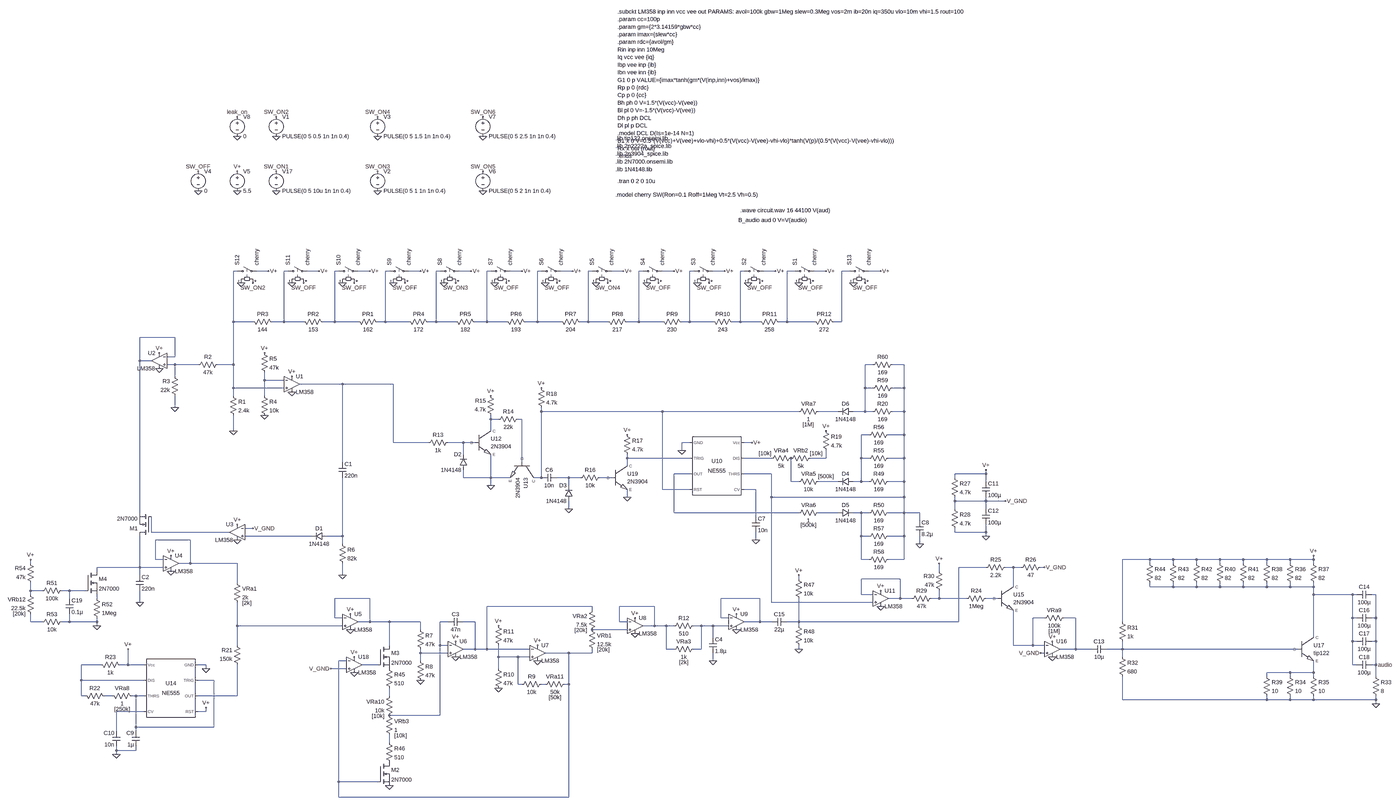
[diagram p0: schematic circuit.asc, whole sheet]
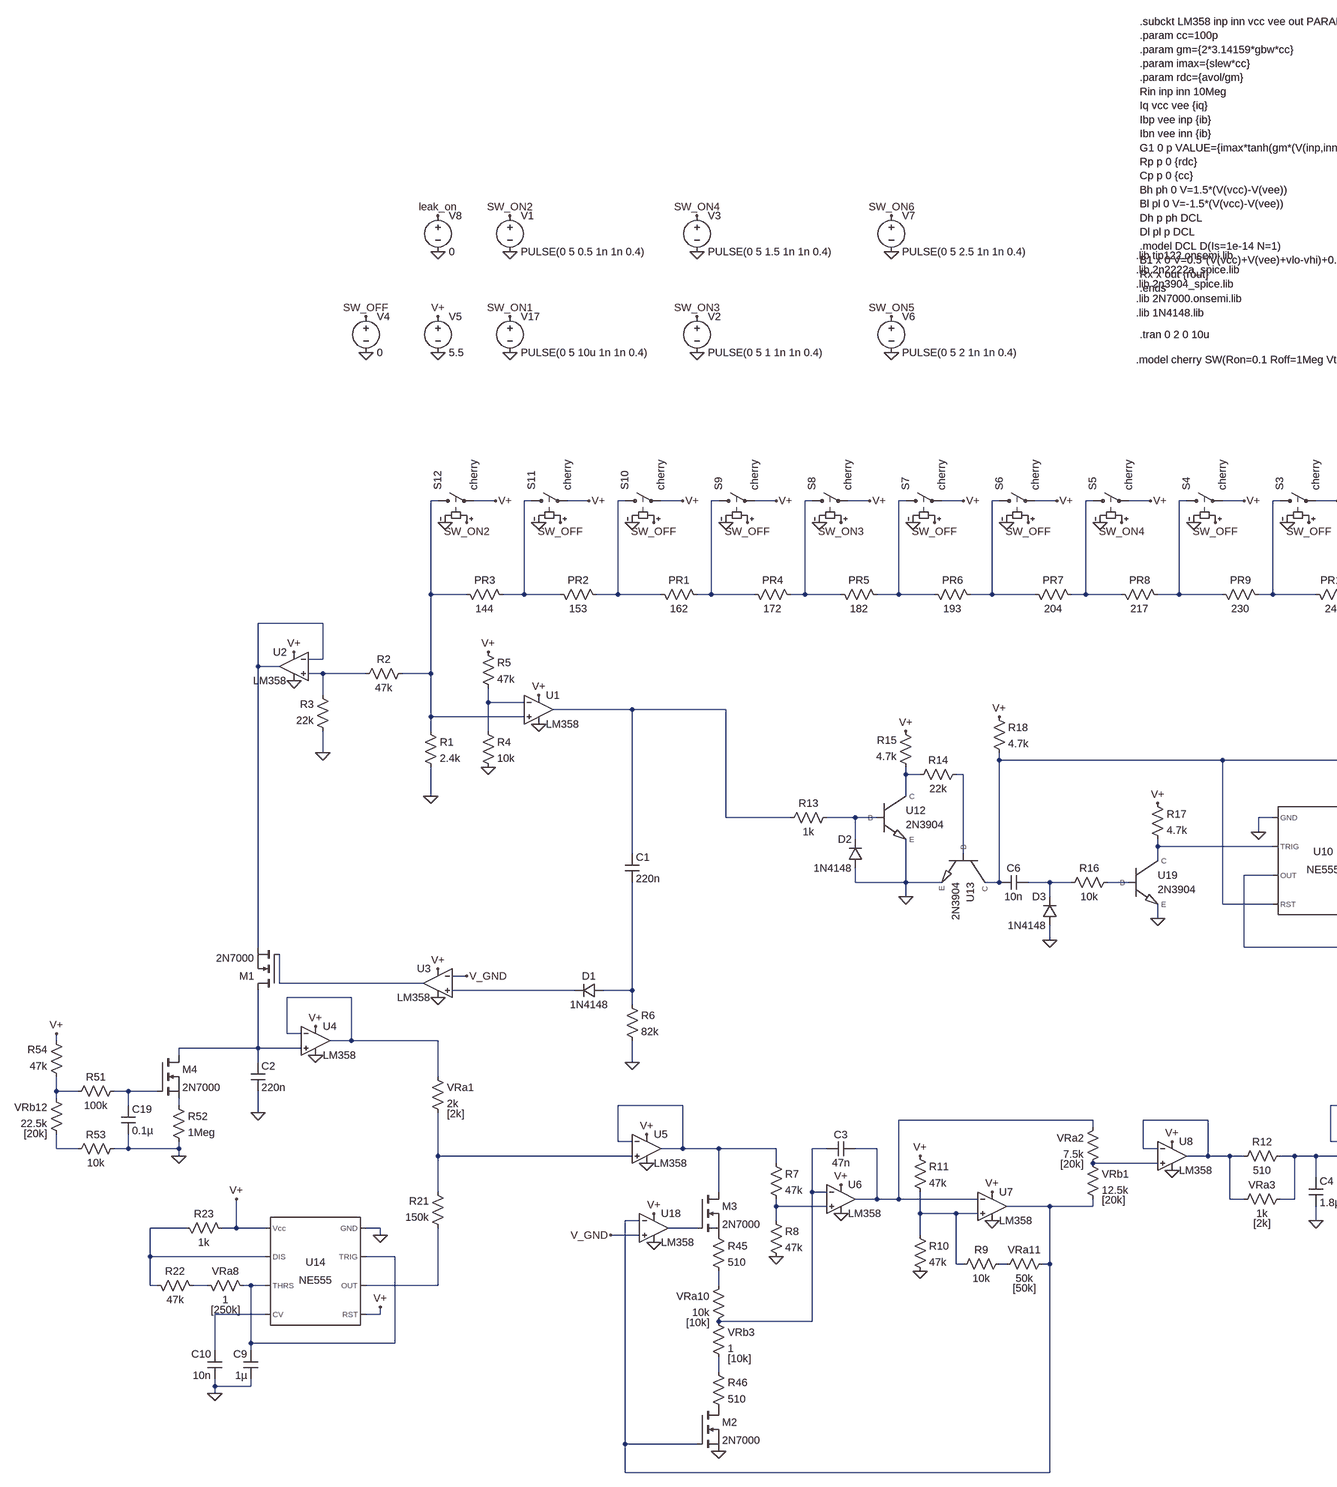
[diagram p1: schematic circuit.asc, part, row 1 of 1, column 1 of 2]
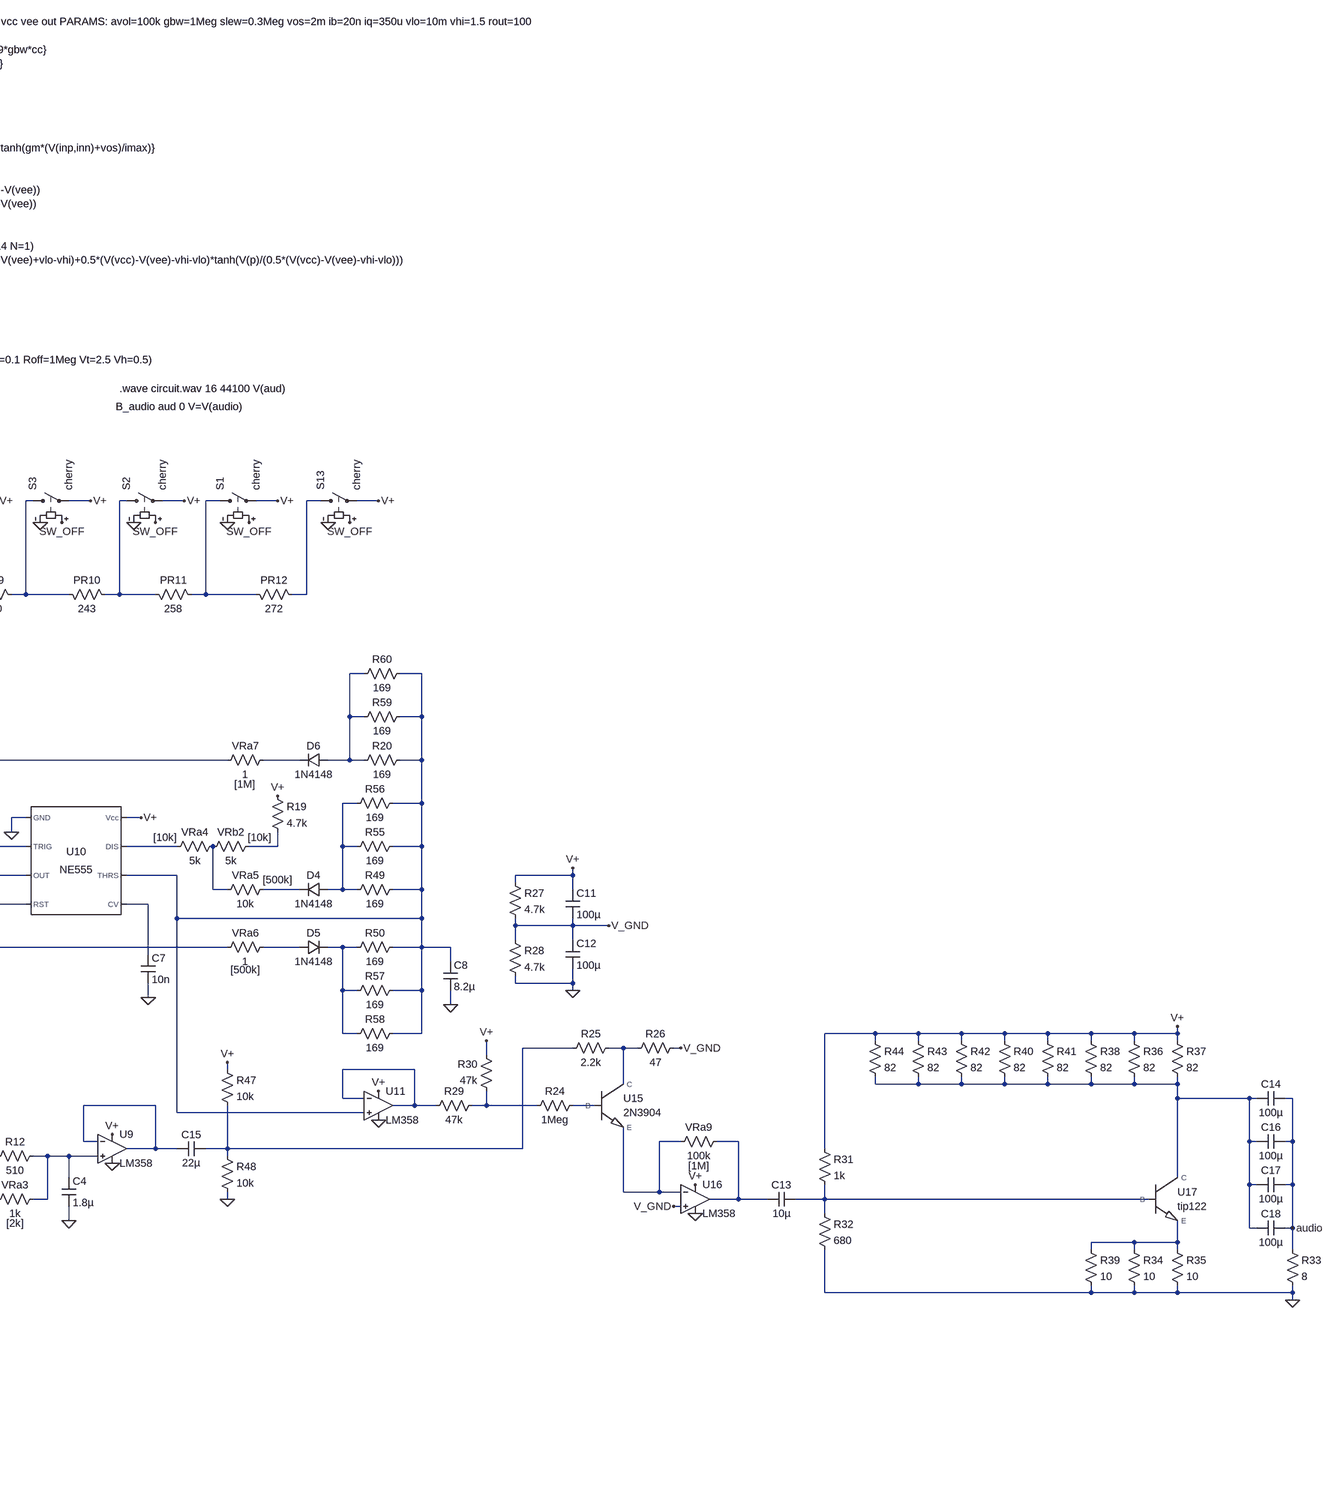
[diagram p2: schematic circuit.asc, part, row 1 of 1, column 2 of 2]
circuit.asc, the LTspice schematic file:
Version 4
SHEET 1 13920 2516
WIRE -1216 -928 -1232 -928
WIRE -1088 -928 -1136 -928
WIRE -1008 -928 -1024 -928
WIRE -880 -928 -928 -928
WIRE -800 -928 -816 -928
WIRE -672 -928 -720 -928
WIRE -592 -928 -608 -928
WIRE -464 -928 -512 -928
WIRE -384 -928 -400 -928
WIRE -256 -928 -304 -928
WIRE -176 -928 -192 -928
WIRE -48 -928 -96 -928
WIRE 32 -928 16 -928
WIRE 160 -928 112 -928
WIRE 240 -928 224 -928
WIRE 368 -928 320 -928
WIRE 448 -928 432 -928
WIRE 576 -928 528 -928
WIRE 656 -928 640 -928
WIRE 784 -928 736 -928
WIRE 864 -928 848 -928
WIRE 992 -928 944 -928
WIRE 1072 -928 1040 -928
WIRE 1200 -928 1152 -928
WIRE 1296 -928 1264 -928
WIRE 1424 -928 1376 -928
WIRE -1232 -720 -1232 -928
WIRE -1152 -720 -1232 -720
WIRE -1024 -720 -1024 -928
WIRE -1024 -720 -1072 -720
WIRE -944 -720 -1024 -720
WIRE -816 -720 -816 -928
WIRE -816 -720 -864 -720
WIRE -720 -720 -816 -720
WIRE -608 -720 -608 -928
WIRE -608 -720 -640 -720
WIRE -512 -720 -608 -720
WIRE -400 -720 -400 -928
WIRE -400 -720 -432 -720
WIRE -320 -720 -400 -720
WIRE -192 -720 -192 -928
WIRE -192 -720 -240 -720
WIRE -112 -720 -192 -720
WIRE 16 -720 16 -928
WIRE 16 -720 -32 -720
WIRE 112 -720 16 -720
WIRE 224 -720 224 -928
WIRE 224 -720 192 -720
WIRE 304 -720 224 -720
WIRE 432 -720 432 -928
WIRE 432 -720 384 -720
WIRE 528 -720 432 -720
WIRE 640 -720 640 -928
WIRE 640 -720 608 -720
WIRE 736 -720 640 -720
WIRE 848 -720 848 -928
WIRE 848 -720 816 -720
WIRE 928 -720 848 -720
WIRE 1040 -720 1040 -928
WIRE 1040 -720 1008 -720
WIRE 1152 -720 1040 -720
WIRE 1264 -720 1264 -928
WIRE 1264 -720 1232 -720
WIRE -1472 -656 -1616 -656
WIRE -1472 -576 -1472 -656
WIRE -1472 -576 -1504 -576
WIRE -1616 -560 -1616 -656
WIRE -1568 -560 -1616 -560
WIRE -1472 -544 -1504 -544
WIRE -1376 -544 -1472 -544
WIRE -1232 -544 -1232 -720
WIRE -1232 -544 -1296 -544
WIRE 1392 -544 1360 -544
WIRE 1520 -544 1472 -544
WIRE -1472 -496 -1472 -544
WIRE -1104 -480 -1104 -512
WIRE -1024 -480 -1104 -480
WIRE -784 -464 -960 -464
WIRE -576 -464 -784 -464
WIRE -1232 -448 -1232 -544
WIRE -1024 -448 -1232 -448
WIRE 1360 -448 1360 -544
WIRE 1392 -448 1360 -448
WIRE 1520 -448 1520 -544
WIRE 1520 -448 1472 -448
WIRE -1232 -416 -1232 -448
WIRE -1104 -416 -1104 -480
WIRE -1472 -368 -1472 -416
WIRE 32 -352 32 -368
WIRE 528 -352 32 -352
WIRE 1088 -352 528 -352
WIRE 1248 -352 1168 -352
WIRE 1360 -352 1360 -448
WIRE 1360 -352 1312 -352
WIRE 1392 -352 1360 -352
WIRE 1520 -352 1520 -448
WIRE 1520 -352 1472 -352
WIRE -176 -320 -176 -336
WIRE -144 -320 -176 -320
WIRE -48 -320 -64 -320
WIRE -1232 -272 -1232 -336
WIRE -176 -272 -176 -320
WIRE 1376 -256 1344 -256
WIRE 1520 -256 1520 -352
WIRE 1520 -256 1456 -256
WIRE -576 -224 -576 -464
WIRE -432 -224 -576 -224
WIRE -288 -224 -352 -224
WIRE -240 -224 -288 -224
WIRE 640 -224 608 -224
WIRE 896 -224 864 -224
WIRE 608 -192 608 -224
WIRE -288 -176 -288 -224
WIRE 384 -160 384 -176
WIRE 640 -160 384 -160
WIRE 976 -160 864 -160
WIRE 1200 -160 1200 -192
WIRE 1200 -160 1136 -160
WIRE 1344 -160 1344 -256
WIRE 1376 -160 1344 -160
WIRE 1520 -160 1520 -256
WIRE 1520 -160 1456 -160
WIRE -784 -144 -784 -464
WIRE -48 -144 -48 -320
WIRE 384 -128 384 -160
WIRE 640 -96 576 -96
WIRE 976 -96 864 -96
WIRE 1856 -96 1856 -112
WIRE 1856 -96 1728 -96
WIRE -288 -80 -288 -112
WIRE -176 -80 -176 -176
WIRE -176 -80 -288 -80
WIRE -96 -80 -176 -80
WIRE 32 -80 32 -352
WIRE 32 -80 0 -80
WIRE 144 -80 96 -80
WIRE 192 -80 144 -80
WIRE 320 -80 272 -80
WIRE 1728 -80 1728 -96
WIRE 1056 -64 1056 -160
WIRE 1088 -64 1056 -64
WIRE 1248 -64 1168 -64
WIRE 1344 -64 1344 -160
WIRE 1344 -64 1312 -64
WIRE 1376 -64 1344 -64
WIRE 1520 -64 1520 -160
WIRE 1520 -64 1456 -64
WIRE 1856 -64 1856 -96
WIRE -176 -48 -176 -80
WIRE 144 -48 144 -80
WIRE 528 -32 528 -352
WIRE 640 -32 528 -32
WIRE 912 -32 864 -32
WIRE 384 0 384 -32
WIRE 976 0 976 -96
WIRE 1520 0 1520 -64
WIRE 1520 0 976 0
WIRE 1728 16 1728 0
WIRE 1856 16 1856 0
WIRE 1856 16 1728 16
WIRE 1936 16 1856 16
WIRE 144 48 144 16
WIRE 1728 48 1728 16
WIRE 1856 48 1856 16
WIRE -1616 64 -1616 -560
WIRE 576 64 576 -96
WIRE 1088 64 576 64
WIRE 1248 64 1168 64
WIRE 1344 64 1312 64
WIRE 1376 64 1344 64
WIRE 1520 64 1520 0
WIRE 1520 64 1456 64
WIRE 1584 64 1520 64
WIRE 912 80 912 -32
WIRE 1584 96 1584 64
WIRE -1152 128 -1184 128
WIRE -1568 144 -1568 80
WIRE -1248 144 -1568 144
WIRE 1728 144 1728 128
WIRE 1856 144 1856 112
WIRE 1856 144 1728 144
WIRE -912 160 -1184 160
WIRE -784 160 -784 -80
WIRE -784 160 -848 160
WIRE 1344 160 1344 64
WIRE 1376 160 1344 160
WIRE 1520 160 1520 64
WIRE 1520 160 1456 160
WIRE 1856 160 1856 144
WIRE -1408 176 -1552 176
WIRE 912 176 912 144
WIRE -784 192 -784 160
WIRE 1584 192 1584 160
WIRE -1552 256 -1552 176
WIRE -1520 256 -1552 256
WIRE 1344 256 1344 160
WIRE 1376 256 1344 256
WIRE 1520 256 1520 160
WIRE 1520 256 1456 256
WIRE 2528 256 2416 256
WIRE 2624 256 2528 256
WIRE 2720 256 2624 256
WIRE 2816 256 2720 256
WIRE 2912 256 2816 256
WIRE 3008 256 2912 256
WIRE 3104 256 3008 256
WIRE 3200 256 3200 240
WIRE 3200 256 3104 256
WIRE -2064 272 -2064 256
WIRE -1408 272 -1408 176
WIRE -1408 272 -1456 272
WIRE -1216 272 -1408 272
WIRE 2528 272 2528 256
WIRE 2624 272 2624 256
WIRE 2720 272 2720 256
WIRE 2816 272 2816 256
WIRE 2912 272 2912 256
WIRE 3008 272 3008 256
WIRE 3104 272 3104 256
WIRE 3200 272 3200 256
WIRE -1616 288 -1616 160
WIRE -1616 288 -1792 288
WIRE -1520 288 -1616 288
WIRE 1856 288 1744 288
WIRE 1968 288 1936 288
WIRE 2000 288 1968 288
WIRE 2096 288 2080 288
WIRE -1792 304 -1792 288
WIRE 1664 304 1664 272
WIRE -1616 320 -1616 288
WIRE -784 320 -784 272
WIRE 1088 336 1088 320
WIRE 1504 336 1344 336
WIRE -1216 352 -1216 272
WIRE 1968 368 1968 288
WIRE 2528 368 2528 352
WIRE 2624 368 2624 352
WIRE 2624 368 2528 368
WIRE 2720 368 2720 352
WIRE 2720 368 2624 368
WIRE 2816 368 2816 352
WIRE 2816 368 2720 368
WIRE 2912 368 2912 352
WIRE 2912 368 2816 368
WIRE 3008 368 3008 352
WIRE 3008 368 2912 368
WIRE 3104 368 3104 352
WIRE 3104 368 3008 368
WIRE 3200 368 3200 352
WIRE 3200 368 3104 368
WIRE -2064 384 -2064 352
WIRE -2016 384 -2064 384
WIRE -1904 384 -1936 384
WIRE -1840 384 -1904 384
WIRE -2064 400 -2064 384
WIRE 1344 400 1344 336
WIRE 1392 400 1344 400
WIRE 3200 400 3200 368
WIRE 3360 400 3200 400
WIRE 3376 400 3360 400
WIRE 3456 400 3440 400
WIRE -1904 416 -1904 384
WIRE -1792 416 -1792 400
WIRE -672 416 -816 416
WIRE 928 416 768 416
WIRE 1504 416 1504 336
WIRE 1504 416 1456 416
WIRE 1552 416 1504 416
WIRE 1664 416 1664 384
WIRE 1664 416 1632 416
WIRE 1776 416 1664 416
WIRE 1904 416 1856 416
WIRE -1616 432 -1616 384
WIRE 976 432 976 0
WIRE 1392 432 976 432
WIRE 240 448 -192 448
WIRE 496 448 352 448
WIRE 240 464 240 448
WIRE -816 496 -816 416
WIRE -784 496 -816 496
WIRE 768 496 768 416
WIRE 800 496 768 496
WIRE 2096 496 2048 496
WIRE 2224 496 2176 496
WIRE 3360 496 3360 400
WIRE 3376 496 3360 496
WIRE 3456 496 3456 400
WIRE 3456 496 3440 496
WIRE -2064 512 -2064 480
WIRE -2016 512 -2064 512
WIRE -1904 512 -1904 480
WIRE -1904 512 -1936 512
WIRE -1792 512 -1792 496
WIRE -1792 512 -1904 512
WIRE -672 512 -672 416
WIRE -672 512 -720 512
WIRE -592 512 -672 512
WIRE -464 512 -592 512
WIRE -352 512 -384 512
WIRE -240 512 -288 512
WIRE 352 512 352 448
WIRE 384 512 352 512
WIRE 928 512 928 416
WIRE 928 512 864 512
WIRE 976 512 928 512
WIRE 1088 512 1088 416
WIRE 1088 512 1040 512
WIRE 1744 512 1744 288
WIRE 1744 512 1088 512
WIRE 2416 512 2416 256
WIRE -1792 528 -1792 512
WIRE -1216 528 -1216 432
WIRE -784 528 -1216 528
WIRE 496 528 496 448
WIRE 496 528 448 528
WIRE 544 528 496 528
WIRE 576 528 544 528
WIRE 688 528 656 528
WIRE 736 528 688 528
WIRE 800 528 736 528
WIRE 1088 528 1088 512
WIRE -464 544 -464 512
WIRE 384 544 240 544
WIRE 736 576 736 528
WIRE 3200 576 3200 400
WIRE 3360 592 3360 496
WIRE 3376 592 3360 592
WIRE 3456 592 3456 496
WIRE 3456 592 3440 592
WIRE -1216 608 -1216 528
WIRE -592 608 -592 512
WIRE -384 608 -384 512
WIRE -352 608 -384 608
WIRE 1968 608 1968 464
WIRE 2048 608 2048 496
WIRE 2048 608 1968 608
WIRE 2096 608 2048 608
WIRE -240 624 -240 512
WIRE -240 624 -288 624
WIRE -192 624 -192 448
WIRE -192 624 -240 624
WIRE -16 624 -192 624
WIRE 544 624 544 528
WIRE 576 624 544 624
WIRE 688 624 688 528
WIRE 688 624 656 624
WIRE 1088 624 1088 608
WIRE 2224 624 2224 496
WIRE 2224 624 2160 624
WIRE 2288 624 2224 624
WIRE 2416 624 2416 592
WIRE 2416 624 2352 624
WIRE 3136 624 2416 624
WIRE -464 640 -464 624
WIRE -352 640 -464 640
WIRE 144 640 48 640
WIRE 240 640 240 624
WIRE 240 640 144 640
WIRE 2096 640 2080 640
WIRE -144 656 -144 608
WIRE -64 656 -144 656
WIRE -16 656 -64 656
WIRE 2416 656 2416 624
WIRE -768 672 -800 672
WIRE -464 672 -464 640
WIRE 736 672 736 640
WIRE -1776 688 -1856 688
WIRE -1664 688 -1664 624
WIRE -1664 688 -1696 688
WIRE -1600 688 -1664 688
WIRE -1344 688 -1376 688
WIRE -640 688 -704 688
WIRE 3360 688 3360 592
WIRE 3376 688 3360 688
WIRE 3456 688 3456 592
WIRE 3456 688 3440 688
WIRE -1344 704 -1344 688
WIRE -768 704 -832 704
WIRE -144 704 -144 656
WIRE 3104 720 3008 720
WIRE 3200 720 3200 672
WIRE 3200 720 3104 720
WIRE 3008 736 3008 720
WIRE 3104 736 3104 720
WIRE 3200 736 3200 720
WIRE 3456 736 3456 688
WIRE -1856 752 -1856 688
WIRE -1600 752 -1856 752
WIRE -1312 752 -1376 752
WIRE -64 768 -64 656
WIRE -48 768 -64 768
WIRE 48 768 32 768
WIRE 144 768 144 640
WIRE 144 768 128 768
WIRE -1856 816 -1856 752
WIRE -1840 816 -1856 816
WIRE -1728 816 -1760 816
WIRE -1632 816 -1648 816
WIRE -1600 816 -1632 816
WIRE -1216 816 -1216 688
WIRE -1216 816 -1376 816
WIRE -592 816 -592 784
WIRE 2416 832 2416 736
WIRE 3008 832 3008 816
WIRE 3008 832 2416 832
WIRE 3104 832 3104 816
WIRE 3104 832 3008 832
WIRE 3200 832 3200 816
WIRE 3200 832 3104 832
WIRE 3456 832 3456 816
WIRE 3456 832 3200 832
WIRE 3456 848 3456 832
WIRE -1600 880 -1712 880
WIRE -1344 880 -1344 864
WIRE -1344 880 -1376 880
WIRE -384 896 -384 608
WIRE -384 896 -592 896
WIRE -1632 944 -1632 816
WIRE -1312 944 -1312 752
WIRE -1312 944 -1632 944
WIRE -1712 960 -1712 880
WIRE -1632 960 -1632 944
WIRE -592 1008 -592 976
WIRE -1712 1040 -1712 1024
WIRE -1632 1040 -1632 1024
WIRE -1632 1040 -1712 1040
WIRE -1712 1056 -1712 1040
WIRE -800 1168 -800 672
WIRE -640 1168 -800 1168
WIRE -800 1232 -800 1168
WIRE 144 1232 144 768
WIRE 144 1232 -800 1232
FLAG -1216 -1456 0
FLAG -1216 -1536 V+
FLAG -1056 -1456 0
FLAG -1056 -1536 SW_ON1
FLAG -1376 -1456 0
FLAG -1376 -1536 SW_OFF
FLAG -1056 -1680 0
FLAG -1056 -1760 SW_ON2
FLAG -640 -1456 0
FLAG -640 -1536 SW_ON3
FLAG -640 -1680 0
FLAG -640 -1760 SW_ON4
FLAG -208 -1456 0
FLAG -208 -1536 SW_ON5
FLAG -208 -1680 0
FLAG -208 -1760 SW_ON6
FLAG 1200 -928 V+
FLAG 992 -928 V+
FLAG 784 -928 V+
FLAG 576 -928 V+
FLAG 368 -928 V+
FLAG 160 -928 V+
FLAG -48 -928 V+
FLAG -256 -928 V+
FLAG -464 -928 V+
FLAG -672 -928 V+
FLAG -880 -928 V+
FLAG -1088 -928 V+
FLAG -1200 -880 0
FLAG -992 -880 0
FLAG -784 -880 0
FLAG -576 -880 0
FLAG -368 -880 0
FLAG -160 -880 0
FLAG 48 -880 0
FLAG 256 -880 0
FLAG 464 -880 0
FLAG 672 -880 0
FLAG 880 -880 0
FLAG 1088 -880 0
FLAG 1136 -880 SW_OFF
FLAG 928 -880 SW_OFF
FLAG 720 -880 SW_OFF
FLAG 512 -880 SW_OFF
FLAG 304 -880 SW_ON4
FLAG 96 -880 SW_OFF
FLAG -112 -880 SW_OFF
FLAG -320 -880 SW_ON3
FLAG -528 -880 SW_OFF
FLAG -736 -880 SW_OFF
FLAG -944 -880 SW_OFF
FLAG -1152 -880 SW_ON2
FLAG -1472 -368 0
FLAG -1104 -592 V+
FLAG -1104 -336 0
FLAG -992 -496 V+
FLAG -992 -432 0
FLAG -1536 -592 V+
FLAG -1536 -528 0
FLAG -784 320 0
FLAG -1216 176 0
FLAG -1216 112 V+
FLAG -1488 240 V+
FLAG -1488 304 0
FLAG -1616 432 0
FLAG -752 480 V+
FLAG -752 544 0
FLAG -320 592 V+
FLAG -320 656 0
FLAG -464 752 0
FLAG 16 608 V+
FLAG 16 672 0
FLAG -144 784 0
FLAG -592 1184 0
FLAG -144 528 V+
FLAG 416 496 V+
FLAG 416 560 0
FLAG 736 672 0
FLAG 832 480 V+
FLAG 832 544 0
FLAG -176 -416 V+
FLAG -176 -48 0
FLAG 144 48 0
FLAG 384 -256 V+
FLAG 384 0 0
FLAG 32 -448 V+
FLAG 1200 -272 V+
FLAG 912 176 0
FLAG 1584 192 0
FLAG 608 -192 0
FLAG 896 -224 V+
FLAG 1424 384 V+
FLAG 1424 448 0
FLAG -1344 864 V+
FLAG -1344 704 0
FLAG -1664 624 V+
FLAG -1712 1056 0
FLAG -1232 -272 0
FLAG 1936 16 V_GND
FLAG 1856 -112 V+
FLAG 1856 160 0
FLAG 2096 288 V_GND
FLAG 2128 592 V+
FLAG 2128 656 0
FLAG 2080 640 V_GND
FLAG 1664 272 V+
FLAG 3456 688 audio
FLAG 3456 848 0
FLAG 3200 240 V+
FLAG -736 656 V+
FLAG -736 720 0
FLAG 1088 624 0
FLAG 1088 320 V+
FLAG -1152 128 V_GND
FLAG -832 704 V_GND
FLAG -1792 528 0
FLAG -2064 256 V+
FLAG -1216 -1680 0
FLAG -1216 -1760 leak_on
FLAG 1424 -928 V+
FLAG 1312 -880 0
FLAG 1360 -880 SW_OFF
SYMBOL voltage -1216 -1552 R0
SYMATTR InstName V5
SYMATTR Value 5.5
SYMBOL voltage -1056 -1552 R0
SYMATTR InstName V17
SYMATTR Value PULSE(0 5 10u 1n 1n 0.4)
SYMBOL voltage -1376 -1552 R0
SYMATTR InstName V4
SYMATTR Value 0
SYMBOL voltage -1056 -1776 R0
SYMATTR InstName V1
SYMATTR Value PULSE(0 5 0.5 1n 1n 0.4)
SYMBOL voltage -640 -1552 R0
SYMATTR InstName V2
SYMATTR Value PULSE(0 5 1 1n 1n 0.4)
SYMBOL voltage -640 -1776 R0
SYMATTR InstName V3
SYMATTR Value PULSE(0 5 1.5 1n 1n 0.4)
SYMBOL voltage -208 -1552 R0
SYMATTR InstName V6
SYMATTR Value PULSE(0 5 2 1n 1n 0.4)
SYMBOL voltage -208 -1776 R0
SYMATTR InstName V7
SYMATTR Value PULSE(0 5 2.5 1n 1n 0.4)
SYMBOL OpAmps/opamp2 -992 -528 R0
SYMATTR InstName U1
SYMATTR Value LM358
SYMBOL nmos -1568 160 R180
SYMATTR InstName M1
SYMATTR Value 2N7000
SYMATTR Prefix X
SYMBOL sw 1056 -928 R270
SYMATTR InstName S1
SYMATTR Value cherry
SYMBOL sw 848 -928 R270
SYMATTR InstName S2
SYMATTR Value cherry
SYMBOL sw 640 -928 R270
SYMATTR InstName S3
SYMATTR Value cherry
SYMBOL sw 432 -928 R270
SYMATTR InstName S4
SYMATTR Value cherry
SYMBOL sw 224 -928 R270
SYMATTR InstName S5
SYMATTR Value cherry
SYMBOL sw 16 -928 R270
SYMATTR InstName S6
SYMATTR Value cherry
SYMBOL sw -192 -928 R270
SYMATTR InstName S7
SYMATTR Value cherry
SYMBOL sw -400 -928 R270
SYMATTR InstName S8
SYMATTR Value cherry
SYMBOL sw -608 -928 R270
SYMATTR InstName S9
SYMATTR Value cherry
SYMBOL sw -816 -928 R270
SYMATTR InstName S10
SYMATTR Value cherry
SYMBOL sw -1024 -928 R270
SYMATTR InstName S11
SYMATTR Value cherry
SYMBOL sw -1232 -928 R270
SYMATTR InstName S12
SYMATTR Value cherry
SYMBOL Res -736 -736 M90
WINDOW 0 0 56 VBottom 2
WINDOW 3 32 56 VTop 2
SYMATTR InstName PR1
SYMATTR Value 162
SYMBOL Res -960 -736 M90
WINDOW 0 0 56 VBottom 2
WINDOW 3 32 56 VTop 2
SYMATTR InstName PR2
SYMATTR Value 153
SYMBOL Res -1168 -736 M90
WINDOW 0 0 56 VBottom 2
WINDOW 3 32 56 VTop 2
SYMATTR InstName PR3
SYMATTR Value 144
SYMBOL Res -1248 -432 R0
SYMATTR InstName R1
SYMATTR Value 2.4k
SYMBOL Res -1280 -560 R90
WINDOW 0 0 56 VBottom 2
WINDOW 3 32 56 VTop 2
SYMATTR InstName R2
SYMATTR Value 47k
SYMBOL Res -1456 -400 R180
WINDOW 0 36 76 Left 2
WINDOW 3 36 40 Left 2
SYMATTR InstName R3
SYMATTR Value 22k
SYMBOL Res -1120 -432 R0
SYMATTR InstName R4
SYMATTR Value 10k
SYMBOL Res -1120 -608 R0
SYMATTR InstName R5
SYMATTR Value 47k
SYMBOL OpAmps/opamp2 -1536 -624 M0
SYMATTR InstName U2
SYMATTR Value LM358
SYMBOL Cap -800 -144 R0
SYMATTR InstName C1
SYMATTR Value 220n
SYMBOL Res -800 176 R0
SYMATTR InstName R6
SYMATTR Value 82k
SYMBOL diode -848 144 R90
WINDOW 0 0 32 VBottom 2
WINDOW 3 32 32 VTop 2
SYMATTR InstName D1
SYMATTR Value 1N4148
SYMATTR Value2 2k
SYMBOL OpAmps/opamp2 -1216 80 M0
SYMATTR InstName U3
SYMATTR Value LM358
SYMBOL Cap -1632 320 R0
WINDOW 39 24 78 Left 2
SYMATTR InstName C2
SYMATTR Value 220n
SYMBOL OpAmps/opamp2 -1488 208 R0
SYMATTR InstName U4
SYMATTR Value LM358
SYMBOL Res -1232 336 R0
WINDOW 123 36 98 Left 2
SYMATTR Value2 [2k]
SYMATTR InstName VRa1
SYMATTR Value 2k
SYMBOL OpAmps/opamp2 -752 448 R0
SYMATTR InstName U5
SYMATTR Value LM358
SYMBOL Res -480 528 R0
SYMATTR InstName R7
SYMATTR Value 47k
SYMBOL Res -480 656 R0
SYMATTR InstName R8
SYMATTR Value 47k
SYMBOL OpAmps/opamp2 -320 560 R0
SYMATTR InstName U6
SYMATTR Value LM358
SYMBOL Cap -288 496 R90
WINDOW 0 0 32 VBottom 2
WINDOW 3 32 32 VTop 2
SYMATTR InstName C3
SYMATTR Value 47n
SYMBOL OpAmps/opamp2 16 576 R0
SYMATTR InstName U7
SYMATTR Value LM358
SYMBOL Res 48 752 R90
WINDOW 0 0 56 VBottom 2
WINDOW 3 32 56 VTop 2
SYMATTR InstName R9
SYMATTR Value 10k
SYMBOL Res -160 688 R0
SYMATTR InstName R10
SYMATTR Value 47k
SYMBOL Res -160 512 R0
SYMATTR InstName R11
SYMATTR Value 47k
SYMBOL nmos -640 1088 R0
SYMATTR InstName M2
SYMATTR Value 2N7000
SYMATTR Prefix X
SYMBOL Res 224 528 R0
WINDOW 123 36 98 Left 2
SYMATTR Value2 [20k]
SYMATTR InstName VRb1
SYMATTR Value 12.5k
SYMBOL Res 256 448 M0
WINDOW 123 36 98 Left 2
SYMATTR Value2 [20k]
SYMATTR InstName VRa2
SYMATTR Value 7.5k
SYMBOL OpAmps/opamp2 416 464 R0
SYMATTR InstName U8
SYMATTR Value LM358
SYMBOL Res 672 512 R90
WINDOW 0 0 56 VBottom 2
WINDOW 3 32 56 VTop 2
SYMATTR InstName R12
SYMATTR Value 510
SYMBOL Res 672 608 R90
WINDOW 0 0 56 VBottom 2
WINDOW 3 32 56 VTop 2
WINDOW 123 54 56 VTop 2
SYMATTR InstName VRa3
SYMATTR Value 1k
SYMATTR Value2 [2k]
SYMBOL Cap 720 576 R0
SYMATTR InstName C4
SYMATTR Value 1.8µ
SYMBOL OpAmps/opamp2 832 448 R0
SYMATTR InstName U9
SYMATTR Value LM358
SYMBOL Res -336 -240 R90
WINDOW 0 0 56 VBottom 2
WINDOW 3 32 56 VTop 2
SYMATTR InstName R13
SYMATTR Value 1k
SYMBOL Diode -272 -112 R180
WINDOW 0 24 64 Left 2
WINDOW 3 24 0 Left 2
SYMATTR InstName D2
SYMATTR Value 1N4148
SYMBOL Res -48 -336 R90
WINDOW 0 0 56 VBottom 2
WINDOW 3 32 56 VTop 2
SYMATTR InstName R14
SYMATTR Value 22k
SYMBOL Res -160 -320 R180
WINDOW 0 36 76 Left 2
WINDOW 3 36 40 Left 2
SYMATTR InstName R15
SYMATTR Value 4.7k
SYMBOL Cap 96 -96 R90
WINDOW 0 0 32 VBottom 2
WINDOW 3 32 32 VTop 2
SYMATTR InstName C6
SYMATTR Value 10n
SYMBOL Diode 160 16 R180
WINDOW 0 24 64 Left 2
WINDOW 3 24 0 Left 2
SYMATTR InstName D3
SYMATTR Value 1N4148
SYMBOL Res 288 -96 R90
WINDOW 0 0 56 VBottom 2
WINDOW 3 32 56 VTop 2
SYMATTR InstName R16
SYMATTR Value 10k
SYMBOL Res 368 -272 R0
SYMATTR InstName R17
SYMATTR Value 4.7k
SYMBOL Misc/NE555 752 -128 R0
SYMATTR InstName U10
SYMBOL Res 16 -464 R0
SYMATTR InstName R18
SYMATTR Value 4.7k
SYMBOL Res 1072 -176 R90
WINDOW 0 0 56 VBottom 2
WINDOW 3 32 56 VTop 2
WINDOW 123 12 122 VBottom 2
SYMATTR InstName VRa4
SYMATTR Value 5k
SYMATTR Value2 [10k]
SYMBOL Res 1152 -176 R90
WINDOW 0 0 56 VBottom 2
WINDOW 3 32 56 VTop 2
WINDOW 123 12 -8 VBottom 2
SYMATTR InstName VRb2
SYMATTR Value 5k
SYMATTR Value2 [10k]
SYMBOL Res 1184 -80 R90
WINDOW 0 0 56 VBottom 2
WINDOW 3 32 56 VTop 2
WINDOW 123 10 -16 VBottom 2
SYMATTR InstName VRa5
SYMATTR Value 10k
SYMATTR Value2 [500k]
SYMBOL Res 1184 -288 R0
SYMATTR InstName R19
SYMATTR Value 4.7k
SYMBOL Diode 1312 -80 R90
WINDOW 0 0 32 VBottom 2
WINDOW 3 32 32 VTop 2
SYMATTR InstName D4
SYMATTR Value 1N4148
SYMBOL Res 1184 48 R90
WINDOW 0 0 56 VBottom 2
WINDOW 3 32 56 VTop 2
WINDOW 123 82 56 VBottom 2
SYMATTR InstName VRa6
SYMATTR Value 1
SYMATTR Value2 [500k]
SYMBOL Diode 1248 80 R270
WINDOW 0 32 32 VTop 2
WINDOW 3 0 32 VBottom 2
SYMATTR InstName D5
SYMATTR Value 1N4148
SYMBOL Res 1184 -368 R90
WINDOW 0 0 56 VBottom 2
WINDOW 3 32 56 VTop 2
WINDOW 123 85 57 VBottom 2
SYMATTR InstName VRa7
SYMATTR Value 1
SYMATTR Value2 [1M]
SYMBOL Diode 1312 -368 R90
WINDOW 0 0 32 VBottom 2
WINDOW 3 32 32 VTop 2
SYMATTR InstName D6
SYMATTR Value 1N4148
SYMBOL Res 1488 -368 R90
WINDOW 0 0 56 VBottom 2
WINDOW 3 32 56 VTop 2
SYMATTR InstName R20
SYMATTR Value 169
SYMBOL Cap 896 80 R0
SYMATTR InstName C7
SYMATTR Value 10n
SYMBOL Cap 1568 96 R0
SYMATTR InstName C8
SYMATTR Value 8.2µ
SYMBOL OpAmps/opamp2 1424 352 R0
SYMATTR InstName U11
SYMATTR Value LM358
SYMBOL 2n3904 -208 -224 R0
WINDOW 39 0 80 Invisible 2
SYMATTR InstName U12
SYMBOL 2n3904 -48 -112 R90
WINDOW 39 0 80 Invisible 2
SYMATTR InstName U13
SYMBOL Misc/NE555 -1488 784 M0
SYMATTR InstName U14
SYMBOL Res -1200 704 R180
WINDOW 0 36 76 Left 2
WINDOW 3 36 40 Left 2
SYMATTR InstName R21
SYMATTR Value 150k
SYMBOL Cap -1616 960 M0
SYMATTR InstName C9
SYMATTR Value 1µ
SYMBOL Res -1744 800 M90
WINDOW 0 0 56 VBottom 2
WINDOW 3 32 56 VTop 2
WINDOW 123 54 56 VTop 2
SYMATTR InstName VRa8
SYMATTR Value 1
SYMATTR Value2 [250k]
SYMBOL Res -1856 800 M90
WINDOW 0 0 56 VBottom 2
WINDOW 3 32 56 VTop 2
SYMATTR InstName R22
SYMATTR Value 47k
SYMBOL Res -1680 704 M270
WINDOW 0 32 56 VTop 2
WINDOW 3 0 56 VBottom 2
SYMATTR InstName R23
SYMATTR Value 1k
SYMBOL Cap -1696 960 M0
SYMATTR InstName C10
SYMATTR Value 10n
SYMBOL 2n3904 1936 416 R0
WINDOW 39 0 80 Invisible 2
SYMATTR InstName U15
SYMBOL Res 1872 400 R90
WINDOW 0 0 56 VBottom 2
WINDOW 3 32 56 VTop 2
SYMATTR InstName R24
SYMATTR Value 1Meg
SYMBOL Res 1952 272 R90
WINDOW 0 0 56 VBottom 2
WINDOW 3 32 56 VTop 2
SYMATTR InstName R25
SYMATTR Value 2.2k
SYMBOL Res 2096 272 R90
WINDOW 0 0 56 VBottom 2
WINDOW 3 32 56 VTop 2
SYMATTR InstName R26
SYMATTR Value 47
SYMBOL Res 1712 -96 R0
SYMATTR InstName R27
SYMATTR Value 4.7k
SYMBOL Res 1712 32 R0
SYMATTR InstName R28
SYMATTR Value 4.7k
SYMBOL Cap 1840 -64 R0
SYMATTR InstName C11
SYMATTR Value 100µ
SYMBOL Cap 1840 48 R0
SYMATTR InstName C12
SYMATTR Value 100µ
SYMBOL OpAmps/opamp2 2128 560 R0
SYMATTR InstName U16
SYMATTR Value LM358
SYMBOL Res 2192 480 R90
WINDOW 0 0 56 VBottom 2
WINDOW 3 32 56 VTop 2
WINDOW 123 54 56 VTop 2
SYMATTR InstName VRa9
SYMATTR Value 100k
SYMATTR Value2 [1M]
SYMBOL Res 1648 400 R90
WINDOW 0 0 56 VBottom 2
WINDOW 3 32 56 VTop 2
SYMATTR InstName R29
SYMATTR Value 47k
SYMBOL Res 1680 400 R180
WINDOW 0 36 76 Left 2
WINDOW 3 36 40 Left 2
SYMATTR InstName R30
SYMATTR Value 47k
SYMBOL Cap 2352 608 R90
WINDOW 0 0 32 VBottom 2
WINDOW 3 32 32 VTop 2
SYMATTR InstName C13
SYMATTR Value 10µ
SYMBOL Res 2400 496 R0
SYMATTR InstName R31
SYMATTR Value 1k
SYMBOL Res 2400 640 R0
SYMATTR InstName R32
SYMATTR Value 680
SYMBOL 2n3904 3168 624 R0
WINDOW 39 0 80 Invisible 2
SYMATTR InstName U17
SYMATTR Value tip122
SYMBOL Cap 3440 384 R90
WINDOW 0 0 32 VBottom 2
WINDOW 3 32 32 VTop 2
SYMATTR InstName C14
SYMATTR Value 100µ
SYMBOL Res 3440 720 R0
SYMATTR InstName R33
SYMATTR Value 8
SYMBOL Res 3088 720 R0
SYMATTR InstName R34
SYMATTR Value 10
SYMBOL Res 3184 720 R0
SYMATTR InstName R35
SYMATTR Value 10
SYMBOL Res 3088 256 R0
SYMATTR InstName R36
SYMATTR Value 82
SYMBOL Res 3184 256 R0
SYMATTR InstName R37
SYMATTR Value 82
SYMBOL Res 2992 256 R0
SYMATTR InstName R38
SYMATTR Value 82
SYMBOL Res 2992 720 R0
SYMATTR InstName R39
SYMATTR Value 10
SYMBOL Res 2800 256 R0
SYMATTR InstName R40
SYMATTR Value 82
SYMBOL Res 2896 256 R0
SYMATTR InstName R41
SYMATTR Value 82
SYMBOL Res 2704 256 R0
SYMATTR InstName R42
SYMATTR Value 82
SYMBOL Res 2608 256 R0
SYMATTR InstName R43
SYMATTR Value 82
SYMBOL Res 2512 256 R0
SYMATTR InstName R44
SYMATTR Value 82
SYMBOL nmos -640 608 R0
SYMATTR InstName M3
SYMATTR Value 2N7000
SYMATTR Prefix X
SYMBOL OpAmps/opamp2 -736 624 R0
SYMATTR InstName U18
SYMATTR Value LM358
SYMBOL Res -608 688 R0
SYMATTR InstName R45
SYMATTR Value 510
SYMBOL Res -576 800 M0
WINDOW 123 36 98 Left 2
SYMATTR Value2 [10k]
SYMATTR InstName VRa10
SYMATTR Value 10k
SYMBOL Res -608 880 R0
WINDOW 123 36 98 Left 2
SYMATTR Value2 [10k]
SYMATTR InstName VRb3
SYMATTR Value 1
SYMBOL Res -608 992 R0
SYMATTR InstName R46
SYMATTR Value 510
SYMBOL Cap 1040 496 R90
WINDOW 0 0 32 VBottom 2
WINDOW 3 32 32 VTop 2
SYMATTR InstName C15
SYMATTR Value 22µ
SYMBOL Res 1072 320 R0
SYMATTR InstName R47
SYMATTR Value 10k
SYMBOL Res 1072 512 R0
SYMATTR InstName R48
SYMATTR Value 10k
SYMBOL Res -528 -736 M90
WINDOW 0 0 56 VBottom 2
WINDOW 3 32 56 VTop 2
SYMATTR InstName PR4
SYMATTR Value 172
SYMBOL Res -336 -736 M90
WINDOW 0 0 56 VBottom 2
WINDOW 3 32 56 VTop 2
SYMATTR InstName PR5
SYMATTR Value 182
SYMBOL Res -128 -736 M90
WINDOW 0 0 56 VBottom 2
WINDOW 3 32 56 VTop 2
SYMATTR InstName PR6
SYMATTR Value 193
SYMBOL Res 96 -736 M90
WINDOW 0 0 56 VBottom 2
WINDOW 3 32 56 VTop 2
SYMATTR InstName PR7
SYMATTR Value 204
SYMBOL Res 288 -736 M90
WINDOW 0 0 56 VBottom 2
WINDOW 3 32 56 VTop 2
SYMATTR InstName PR8
SYMATTR Value 217
SYMBOL Res 512 -736 M90
WINDOW 0 0 56 VBottom 2
WINDOW 3 32 56 VTop 2
SYMATTR InstName PR9
SYMATTR Value 230
SYMBOL Res 720 -736 M90
WINDOW 0 0 56 VBottom 2
WINDOW 3 32 56 VTop 2
SYMATTR InstName PR10
SYMATTR Value 243
SYMBOL Res 912 -736 M90
WINDOW 0 0 56 VBottom 2
WINDOW 3 32 56 VTop 2
SYMATTR InstName PR11
SYMATTR Value 258
SYMBOL 2n3904 352 -80 R0
WINDOW 39 0 80 Invisible 2
SYMATTR InstName U19
SYMBOL Res 1472 -80 R90
WINDOW 0 0 56 VBottom 2
WINDOW 3 32 56 VTop 2
SYMATTR InstName R49
SYMATTR Value 169
SYMBOL Res 1472 48 R90
WINDOW 0 0 56 VBottom 2
WINDOW 3 32 56 VTop 2
SYMATTR InstName R50
SYMATTR Value 169
SYMBOL Cap 3440 480 R90
WINDOW 0 0 32 VBottom 2
WINDOW 3 32 32 VTop 2
SYMATTR InstName C16
SYMATTR Value 100µ
SYMBOL Cap 3440 576 R90
WINDOW 0 0 32 VBottom 2
WINDOW 3 32 32 VTop 2
SYMATTR InstName C17
SYMATTR Value 100µ
SYMBOL Cap 3440 672 R90
WINDOW 0 0 32 VBottom 2
WINDOW 3 32 32 VTop 2
SYMATTR InstName C18
SYMATTR Value 100µ
SYMBOL nmos -1840 304 R0
SYMATTR InstName M4
SYMATTR Value 2N7000
SYMATTR Prefix X
SYMBOL Cap -1920 416 R0
SYMATTR InstName C19
SYMATTR Value 0.1µ
SYMBOL Res -1920 368 R90
WINDOW 0 0 56 VBottom 2
WINDOW 3 32 56 VTop 2
SYMATTR InstName R51
SYMATTR Value 100k
SYMBOL Res -2048 496 R180
WINDOW 0 36 76 Left 2
WINDOW 3 36 40 Left 2
WINDOW 123 36 18 Left 2
SYMATTR InstName VRb12
SYMATTR Value 22.5k
SYMATTR Value2 [20k]
SYMBOL Res -2048 368 R180
WINDOW 0 36 76 Left 2
WINDOW 3 36 40 Left 2
SYMATTR InstName R54
SYMATTR Value 47k
SYMBOL voltage -1216 -1776 R0
SYMATTR InstName V8
SYMATTR Value 0
SYMBOL Res -1808 400 R0
SYMATTR InstName R52
SYMATTR Value 1Meg
SYMBOL Res -1920 496 R90
WINDOW 0 0 56 VBottom 2
WINDOW 3 32 56 VTop 2
SYMATTR InstName R53
SYMATTR Value 10k
SYMBOL Res 144 752 R90
WINDOW 0 0 56 VBottom 2
WINDOW 3 32 56 VTop 2
WINDOW 123 54 56 VTop 2
SYMATTR InstName VRa11
SYMATTR Value 50k
SYMATTR Value2 [50k]
SYMBOL sw 1280 -928 R270
SYMATTR InstName S13
SYMATTR Value cherry
SYMBOL Res 1136 -736 M90
WINDOW 0 0 56 VBottom 2
WINDOW 3 32 56 VTop 2
SYMATTR InstName PR12
SYMATTR Value 272
SYMBOL Res 1472 -176 R90
WINDOW 0 0 56 VBottom 2
WINDOW 3 32 56 VTop 2
SYMATTR InstName R55
SYMATTR Value 169
SYMBOL Res 1472 -272 R90
WINDOW 0 0 56 VBottom 2
WINDOW 3 32 56 VTop 2
SYMATTR InstName R56
SYMATTR Value 169
SYMBOL Res 1472 144 R90
WINDOW 0 0 56 VBottom 2
WINDOW 3 32 56 VTop 2
SYMATTR InstName R57
SYMATTR Value 169
SYMBOL Res 1472 240 R90
WINDOW 0 0 56 VBottom 2
WINDOW 3 32 56 VTop 2
SYMATTR InstName R58
SYMATTR Value 169
SYMBOL Res 1488 -464 R90
WINDOW 0 0 56 VBottom 2
WINDOW 3 32 56 VTop 2
SYMATTR InstName R59
SYMATTR Value 169
SYMBOL Res 1488 -560 R90
WINDOW 0 0 56 VBottom 2
WINDOW 3 32 56 VTop 2
SYMATTR InstName R60
SYMATTR Value 169
TEXT 344 -1496 Left 2 !.tran 0 2 0 10u
TEXT 336 -1576 Left 2 !.lib 2N7000.onsemi.lib
TEXT 336 -1440 Left 2 !.model cherry SW(Ron=0.1 Roff=1Meg Vt=2.5 Vh=0.5)
TEXT 336 -1544 Left 2 !.lib 1N4148.lib
TEXT 344 -2192 Left 2 !.subckt LM358 inp inn vcc vee out PARAMS: avol=100k gbw=1Meg slew=0.3Meg vos=2m ib=20n iq=350u vlo=10m vhi=1.5 rout=100\n.param cc=100p\n.param gm={2*3.14159*gbw*cc}\n.param imax={slew*cc}\n.param rdc={avol/gm}\nRin inp inn 10Meg\nIq vcc vee {iq}\nIbp vee inp {ib}\nIbn vee inn {ib}\nG1 0 p VALUE={imax*tanh(gm*(V(inp,inn)+vos)/imax)}\nRp p 0 {rdc}\nCp p 0 {cc}\nBh ph 0 V=1.5*(V(vcc)-V(vee))\nBl pl 0 V=-1.5*(V(vcc)-V(vee))\nDh p ph DCL\nDl pl p DCL\n.model DCL D(Is=1e-14 N=1)\nB1 x 0 V=0.5*(V(vcc)+V(vee)+vlo-vhi)+0.5*(V(vcc)-V(vee)-vhi-vlo)*tanh(V(p)/(0.5*(V(vcc)-V(vee)-vhi-vlo)))\nRx x out {rout}\n.ends
TEXT 336 -1608 Left 2 !.lib 2n3904_spice.lib
TEXT 336 -1640 Left 2 !.lib 2n2222a_spice.lib
TEXT 840 -1336 Left 2 !B_audio aud 0 V=V(audio)
TEXT 848 -1376 Left 2 !.wave circuit.wav 16 44100 V(aud)
TEXT 336 -1672 Left 2 !.lib tip122.onsemi.lib

The netlist it stands for:
* circuit.asc
V5 V+ 0 5.5
V17 SW_ON1 0 PULSE(0 5 10u 1n 1n 0.4)
V4 SW_OFF 0 0
V1 SW_ON2 0 PULSE(0 5 0.5 1n 1n 0.4)
V2 SW_ON3 0 PULSE(0 5 1 1n 1n 0.4)
V3 SW_ON4 0 PULSE(0 5 1.5 1n 1n 0.4)
V6 SW_ON5 0 PULSE(0 5 2 1n 1n 0.4)
V7 SW_ON6 0 PULSE(0 5 2.5 1n 1n 0.4)
XU1 N001 N018 V+ 0 N019 LM358  ; pins In+ In- V+ V- OUT
XM1 N041 N037 N014 2N7000  ; pins D G S
S1 N012 V+ SW_OFF 0 cherry
S2 N011 V+ SW_OFF 0 cherry
S3 N010 V+ SW_OFF 0 cherry
S4 N009 V+ SW_OFF 0 cherry
S5 N008 V+ SW_ON4 0 cherry
S6 N007 V+ SW_OFF 0 cherry
S7 N006 V+ SW_OFF 0 cherry
S8 N005 V+ SW_ON3 0 cherry
S9 N004 V+ SW_OFF 0 cherry
S10 N003 V+ SW_OFF 0 cherry
S11 N002 V+ SW_OFF 0 cherry
S12 N001 V+ SW_ON2 0 cherry
R§PR1 N003 N004 162
R§PR2 N002 N003 153
R§PR3 N001 N002 144
R1 N001 0 2.4k
R2 N001 N015 47k
R3 0 N015 22k
R4 N018 0 10k
R5 V+ N018 47k
XU2 N015 N014 V+ 0 N014 LM358  ; pins In+ In- V+ V- OUT
C1 N019 N039 220n
R6 N039 0 82k
D1 N039 N038 1N4148 2k
XU3 N038 V_GND V+ 0 N037 LM358  ; pins In+ In- V+ V- OUT
C2 N041 0 220n
XU4 N041 N040 V+ 0 N040 LM358  ; pins In+ In- V+ V- OUT
R§VRa1 N040 N059 2k [2k]
XU5 N059 N049 V+ 0 N049 LM358  ; pins In+ In- V+ V- OUT
R7 N049 N063 47k
R8 N063 0 47k
XU6 N063 N058 V+ 0 N053 LM358  ; pins In+ In- V+ V- OUT
C3 N053 N058 47n
XU7 N065 N053 V+ 0 N064 LM358  ; pins In+ In- V+ V- OUT
R9 N070 N065 10k
R10 N065 0 47k
R11 V+ N065 47k
XM2 P001 N064 0 2N7000  ; pins D G S
R§VRb1 N061 N064 12.5k [20k]
R§VRa2 N053 N061 7.5k [20k]
XU8 N061 N054 V+ 0 N054 LM358  ; pins In+ In- V+ V- OUT
R12 N060 N054 510
R§VRa3 N060 N054 1k [2k]
C4 N060 0 1.8µ
XU9 N060 N050 V+ 0 N050 LM358  ; pins In+ In- V+ V- OUT
R13 N025 N019 1k
D2 0 N025 1N4148
R14 N023 N022 22k
R15 N022 V+ 4.7k
C6 N030 N020 10n
D3 0 N030 1N4148
R16 N031 N030 10k
R17 V+ N026 4.7k
XU10 0 N026 N029 N020 N034 N017 N027 V+ NE555  ; pins GND TRIG OUT RST CV THRS DIS Vcc
R18 V+ N020 4.7k
R§VRa4 N032 N027 5k [10k]
R§VRb2 N028 N032 5k [10k]
R§VRa5 N033 N032 10k [500k]
R19 V+ N028 4.7k
D4 N024 N033 1N4148
R§VRa6 N035 N029 1 [500k]
D5 N035 N036 1N4148
R§VRa7 N021 N020 1 [1M]
D6 N016 N021 1N4148
R20 N017 N016 169
C7 N034 0 10n
C8 N017 0 8.2µ
XU11 N017 N044 V+ 0 N044 LM358  ; pins In+ In- V+ V- OUT
XU12 N022 N025 0 2N3904 Vceo=40 Vcbo=60 Vebo=6 Ic=200m hfe=300 Ices=50n Vbe=1000m ft=300Meg Ccbo=4p Cebo=8p Rc=1 Rb=.1 Re=.1 Eg=1.11 Xti=3  ; pins C B E
XU13 N020 N023 0 2N3904 Vceo=40 Vcbo=60 Vebo=6 Ic=200m hfe=300 Ices=50n Vbe=1000m ft=300Meg Ccbo=4p Cebo=8p Rc=1 Rb=.1 Re=.1 Eg=1.11 Xti=3  ; pins C B E
XU14 0 N069 N072 V+ N074 N069 N066 V+ NE555  ; pins GND TRIG OUT RST CV THRS DIS Vcc
R21 N072 N059 150k
C9 N069 0 1µ
R§VRa8 N071 N069 1 [250k]
R22 N066 N071 47k
R23 V+ N066 1k
C10 N074 0 10n
XU15 N043 N052 N055 2N3904 Vceo=40 Vcbo=60 Vebo=6 Ic=200m hfe=300 Ices=50n Vbe=1000m ft=300Meg Ccbo=4p Cebo=8p Rc=1 Rb=.1 Re=.1 Eg=1.11 Xti=3  ; pins C B E
R24 N052 N051 1Meg
R25 N043 N042 2.2k
R26 V_GND N043 47
R27 V+ V_GND 4.7k
R28 V_GND 0 4.7k
C11 V+ V_GND 100µ
C12 V_GND 0 100µ
XU16 V_GND N055 V+ 0 N056 LM358  ; pins In+ In- V+ V- OUT
R§VRa9 N056 N055 100k [1M]
R29 N051 N044 47k
R30 N051 V+ 47k
C13 N062 N056 10µ
R31 V+ N062 1k
R32 N062 0 680
XU17 N045 N062 N068 tip122 Vceo=40 Vcbo=60 Vebo=6 Ic=200m hfe=300 Ices=50n Vbe=1000m ft=300Meg Ccbo=4p Cebo=8p Rc=1 Rb=.1 Re=.1 Eg=1.11 Xti=3  ; pins C B E
C14 audio N045 100µ
R33 audio 0 8
R34 N068 0 10
R35 N068 0 10
R36 V+ N045 82
R37 V+ N045 82
R38 V+ N045 82
R39 N068 0 10
R40 V+ N045 82
R41 V+ N045 82
R42 V+ N045 82
R43 V+ N045 82
R44 V+ N045 82
XM3 N049 N067 P002 2N7000  ; pins D G S
XU18 V_GND N064 V+ 0 N067 LM358  ; pins In+ In- V+ V- OUT
R45 P002 N073 510
R§VRa10 N073 N058 10k [10k]
R§VRb3 N058 N075 1 [10k]
R46 N075 P001 510
C15 N042 N050 22µ
R47 V+ N042 10k
R48 N042 0 10k
R§PR4 N004 N005 172
R§PR5 N005 N006 182
R§PR6 N006 N007 193
R§PR7 N007 N008 204
R§PR8 N008 N009 217
R§PR9 N009 N010 230
R§PR10 N010 N011 243
R§PR11 N011 N012 258
XU19 N026 N031 0 2N3904 Vceo=40 Vcbo=60 Vebo=6 Ic=200m hfe=300 Ices=50n Vbe=1000m ft=300Meg Ccbo=4p Cebo=8p Rc=1 Rb=.1 Re=.1 Eg=1.11 Xti=3  ; pins C B E
R49 N017 N024 169
R50 N017 N036 169
C16 audio N045 100µ
C17 audio N045 100µ
C18 audio N045 100µ
XM4 N041 N047 N048 2N7000  ; pins D G S
C19 N047 0 0.1µ
R51 N047 N046 100k
R§VRb12 N057 N046 22.5k [20k]
R54 N046 V+ 47k
V8 leak_on 0 0
R52 N048 0 1Meg
R53 0 N057 10k
R§VRa11 N064 N070 50k [50k]
S13 N013 V+ SW_OFF 0 cherry
R§PR12 N012 N013 272
R55 N017 N024 169
R56 N017 N024 169
R57 N017 N036 169
R58 N017 N036 169
R59 N017 N016 169
R60 N017 N016 169
.model D D
.lib standard.dio
.tran 0 2 0 10u
.lib 2N7000.onsemi.lib
.model cherry SW(Ron=0.1 Roff=1Meg Vt=2.5 Vh=0.5)
.lib 1N4148.lib
.subckt LM358 inp inn vcc vee out PARAMS: avol=100k gbw=1Meg slew=0.3Meg vos=2m ib=20n iq=350u vlo=10m vhi=1.5 rout=100
.param cc=100p
.param gm={2*3.14159*gbw*cc}
.param imax={slew*cc}
.param rdc={avol/gm}
Rin inp inn 10Meg
Iq vcc vee {iq}
Ibp vee inp {ib}
Ibn vee inn {ib}
G1 0 p VALUE={imax*tanh(gm*(V(inp,inn)+vos)/imax)}
Rp p 0 {rdc}
Cp p 0 {cc}
Bh ph 0 V=1.5*(V(vcc)-V(vee))
Bl pl 0 V=-1.5*(V(vcc)-V(vee))
Dh p ph DCL
Dl pl p DCL
.model DCL D(Is=1e-14 N=1)
B1 x 0 V=0.5*(V(vcc)+V(vee)+vlo-vhi)+0.5*(V(vcc)-V(vee)-vhi-vlo)*tanh(V(p)/(0.5*(V(vcc)-V(vee)-vhi-vlo)))
Rx x out {rout}
.ends
.lib 2n3904_spice.lib
.lib 2n2222a_spice.lib
B_audio aud 0 V=V(audio)
.wave circuit.wav 16 44100 V(aud)
.lib tip122.onsemi.lib
.lib NE555.sub
.lib .\2n3904_spice.lib
.backanno
.end